# Altium schematic sheet Safety_Watchdog.SchDoc: 14 - Heartbeats, armamento e desligamento
size A3; Project: CM5 Photonic Bias Controller; DocumentRev: R5; ProjectRev: R5; Version: Rev R6; SheetNumber: 15; SheetTotal: 17; Author: Carlos Renan; SCH_SCALE: N/A; Address1: UFCG; Address2: Referencia: VIRTUS CC; Address3: Campina Grande - PB; ProjectName: Controle automatico de BIAS para MZM/IQ - Projeto 3; DocumentName: Safety_Watchdog.SchDoc
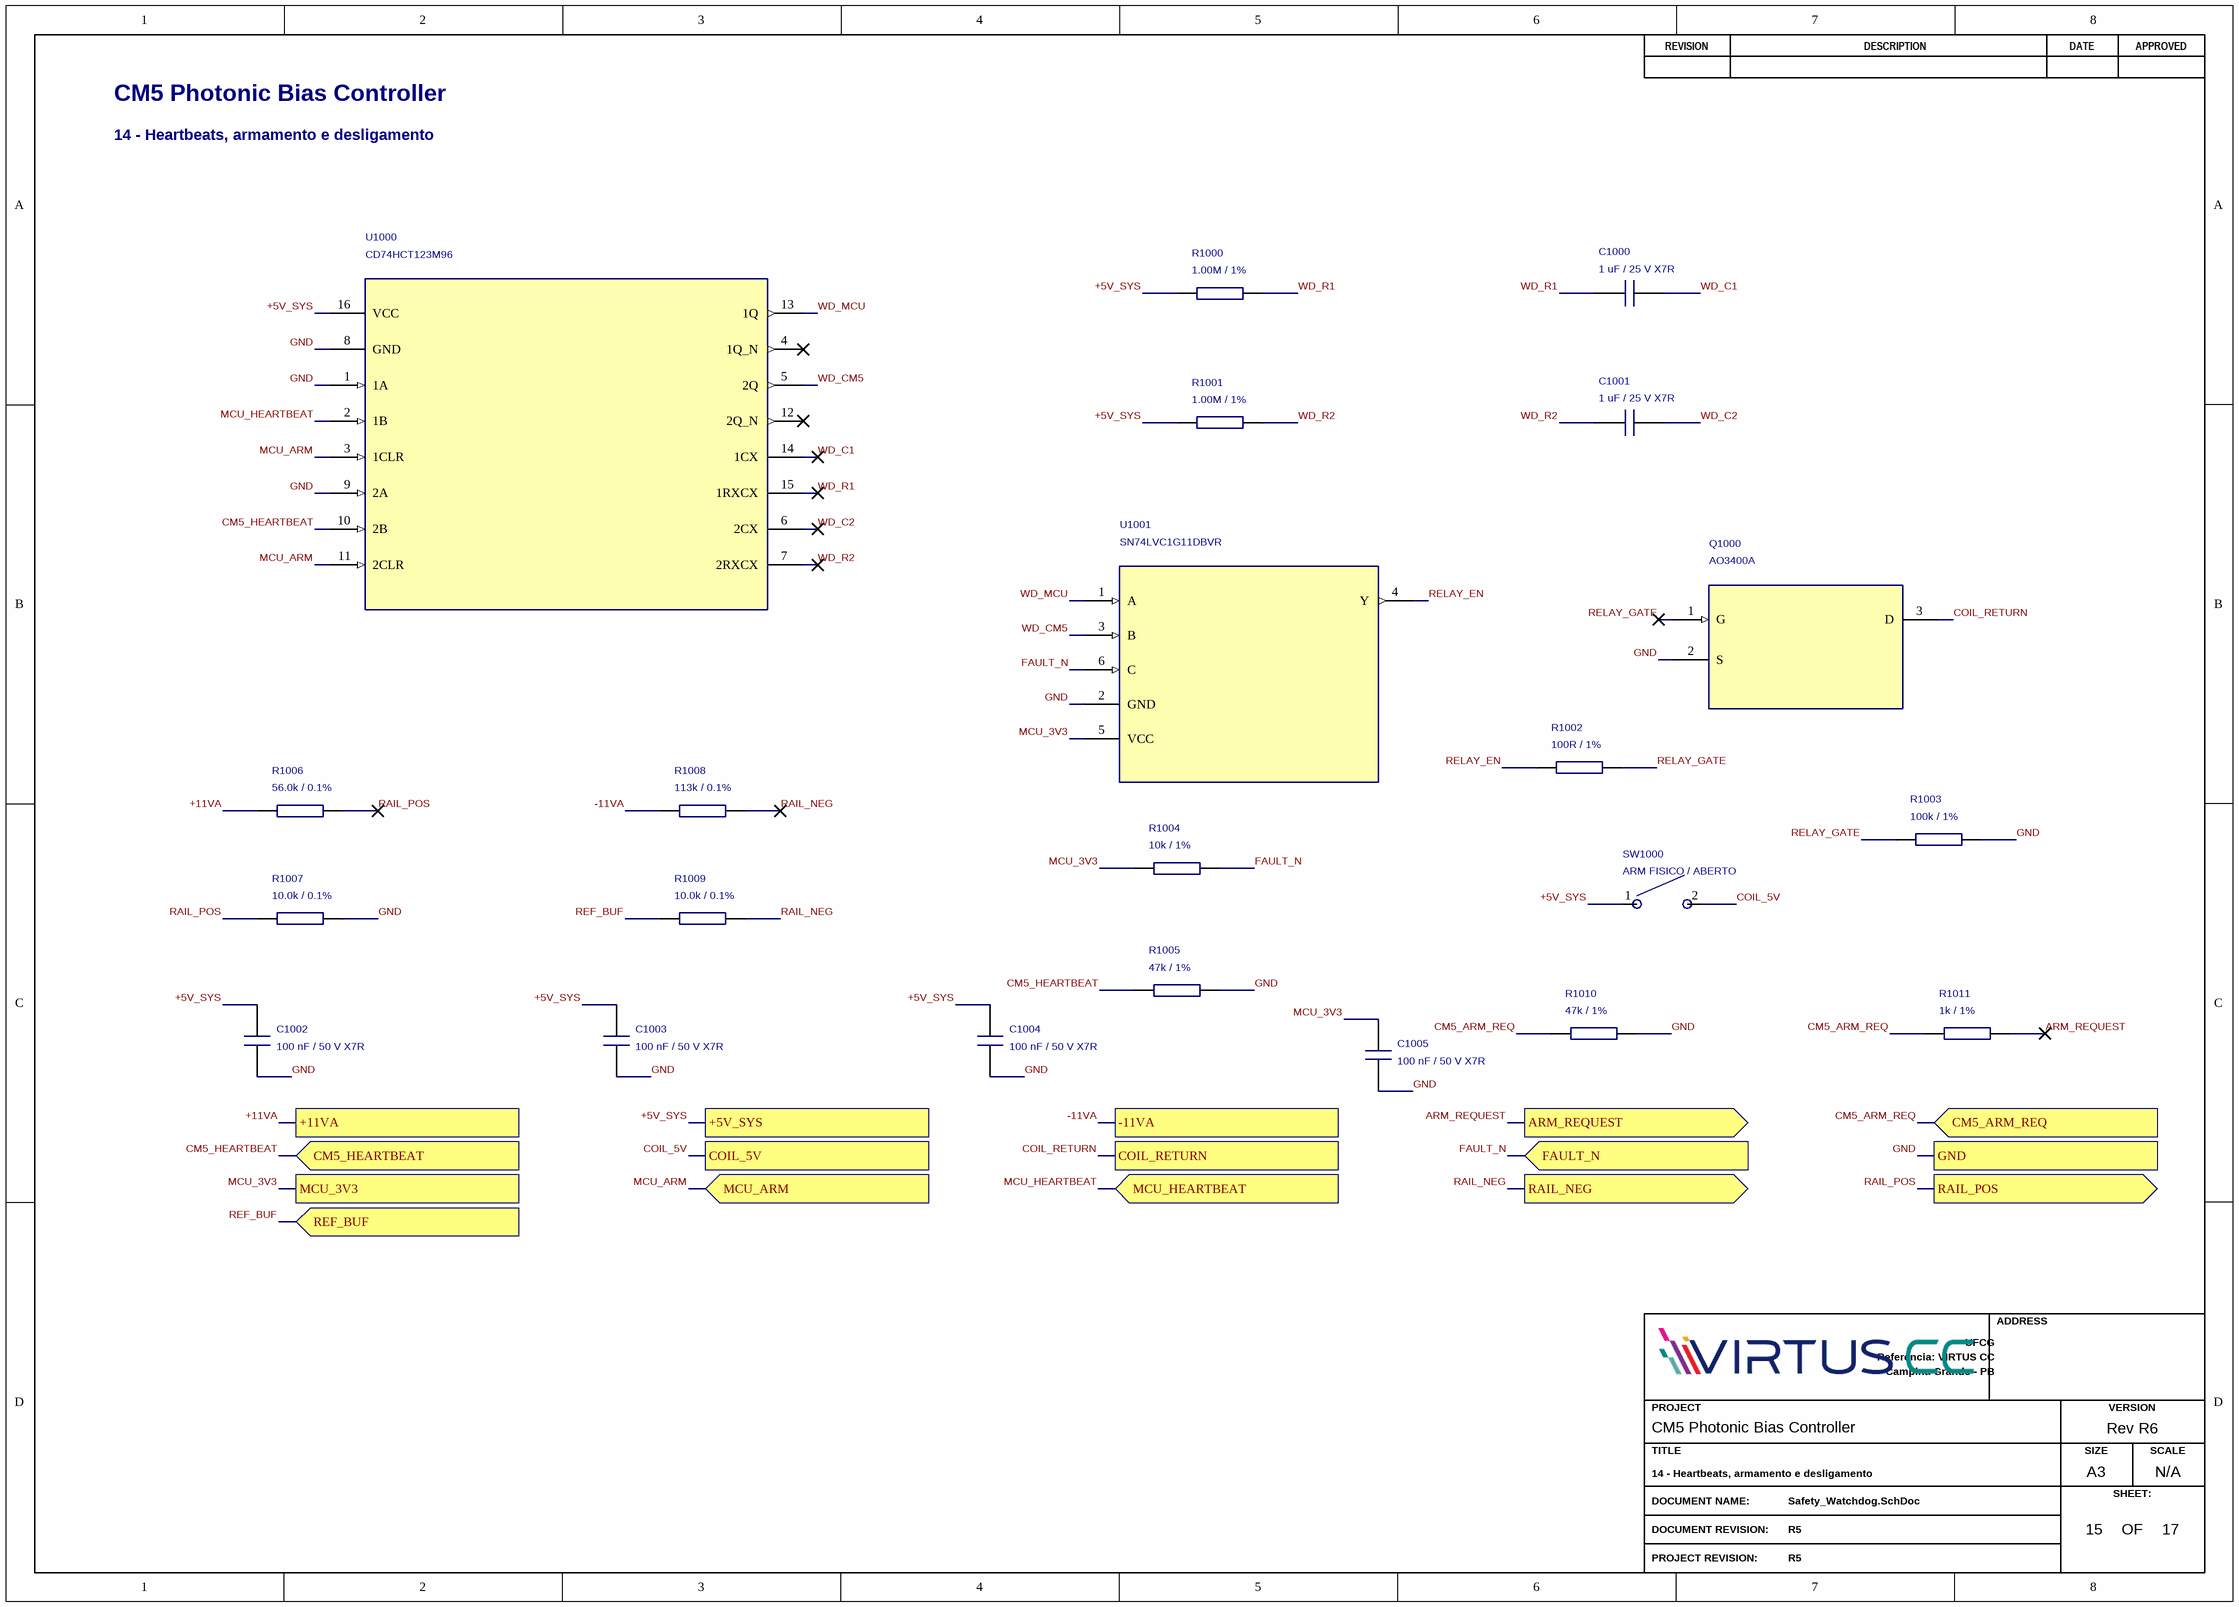
[diagram p0: Safety_Watchdog.SchDoc]

## Parts
C1000  1 uF / 25 V X7R  [C0805]
C1001  1 uF / 25 V X7R  [C0805]
C1002  100 nF / 50 V X7R  [C0805]
C1003  100 nF / 50 V X7R  [C0805]
C1004  100 nF / 50 V X7R  [C0805]
C1005  100 nF / 50 V X7R  [C0805]
Q1000  AO3400A  [ONSC-SOT-23-3-318-08_V]
R1000  1.00M / 1%  [R-0603]
R1001  1.00M / 1%  [R-0603]
R1002  100R / 1%  [R-0603]
R1003  100k / 1%  [R-0603]
R1004  10k / 1%  [R-0603]
R1005  47k / 1%  [R-0603]
R1006  56.0k / 0.1%  [R-0603]
R1007  10.0k / 0.1%  [R-0603]
R1008  113k / 0.1%  [R-0603]
R1009  10.0k / 0.1%  [R-0603]
R1010  47k / 1%  [R-0603]
R1011  1k / 1%  [R-0603]
SW1000  ARM FISICO / ABERTO  [HDR_1X02_P254]
U1000  CD74HCT123M96  [SOIC16]
U1001  SN74LVC1G11DBVR  [SOT26]

## Ports
+5V_SYS, +11VA, -11VA, ARM_REQUEST (out), CM5_ARM_REQ (in), CM5_HEARTBEAT (in), COIL_5V, COIL_RETURN, FAULT_N (in), GND, MCU_3V3, MCU_ARM (in), MCU_HEARTBEAT (in), RAIL_NEG (out), RAIL_POS (out), REF_BUF (in)

## Nets
+5V_SYS: C1002.1 C1003.1 C1004.1 R1000.1 R1001.1 SW1000.1 U1000.16(VCC) ; port +5V_SYS
+11VA: R1006.1 ; port +11VA
-11VA: R1008.1 ; port -11VA
ARM_REQUEST: R1011.2 ; port ARM_REQUEST
CM5_ARM_REQ: R1010.1 R1011.1 ; port CM5_ARM_REQ
CM5_HEARTBEAT: R1005.1 U1000.10(2B) ; port CM5_HEARTBEAT
COIL_5V: SW1000.2 ; port COIL_5V
COIL_RETURN: Q1000.3(D) ; port COIL_RETURN
FAULT_N: R1004.2 U1001.6(C) ; port FAULT_N
GND: C1002.2 C1003.2 C1004.2 C1005.2 Q1000.2(S) R1003.2 R1005.2 R1007.2 R1010.2 U1000.1(1A) U1000.8(GND) U1000.9(2A) U1001.2(GND) ; port GND
MCU_3V3: C1005.1 R1004.1 U1001.5(VCC) ; port MCU_3V3
MCU_ARM: U1000.3(1CLR) U1000.11(2CLR) ; port MCU_ARM
MCU_HEARTBEAT: U1000.2(1B) ; port MCU_HEARTBEAT
RAIL_NEG: R1008.2 R1009.2 ; port RAIL_NEG
RAIL_POS: R1006.2 R1007.1 ; port RAIL_POS
REF_BUF: R1009.1 ; port REF_BUF
RELAY_EN: R1002.1 U1001.4(Y)
RELAY_GATE: Q1000.1(G) R1002.2 R1003.1
WD_C1: C1000.2 U1000.14(1CX)
WD_C2: C1001.2 U1000.6(2CX)
WD_CM5: U1000.5(2Q) U1001.3(B)
WD_MCU: U1000.13(1Q) U1001.1(A)
WD_R1: C1000.1 R1000.2 U1000.15(1RXCX)
WD_R2: C1001.1 R1001.2 U1000.7(2RXCX)

Not connected (* = marked no-connect by the designer): U1000 4(1Q_N)* 12(2Q_N)*

## Notes on the sheet
- CM5 Photonic Bias Controller
- 14 - Heartbeats, armamento e desligamento
- REVISION
- DESCRIPTION
- DATE
- APPROVED
- ADDRESS
- PROJECT
- VERSION
- TITLE
- A3
- SIZE
- SCALE
- DOCUMENT NAME:
- DOCUMENT REVISION:
- OF
- SHEET:
- PROJECT REVISION:

## Library data of the parts
C1000 C1001 = 1 uF: Manufacturer: KEMET; Manufacturer Part Number: C0805C105K3RACTU; Procurement Status: Busca por MPN; SKU e disponibilidade a confirmar; BOM Purchase: Yes; Manufacturer 1: KEMET; Manufacturer Part Number 1: C0805C105K3RACTU; Supplier 1: DigiKey; Supplier URL 1: https://www.digikey.com.br/pt/products/result?keywords=C0805C105K3RACTU; Supplier 2: Mouser; Supplier URL 2: https://br.mouser.com/c/?q=C0805C105K3RACTU; Datasheet: https://www.yageogroup.com/download/specsheet/C0805C105K3RACTU
C1002-C1005 = 100 nF: Manufacturer: KEMET; Manufacturer Part Number: C0805C104K5RACTU; Procurement Status: Busca por MPN; SKU e disponibilidade a confirmar; BOM Purchase: Yes; Manufacturer 1: KEMET; Manufacturer Part Number 1: C0805C104K5RACTU; Supplier 1: DigiKey; Supplier URL 1: https://www.digikey.com.br/pt/products/result?keywords=C0805C104K5RACTU; Supplier 2: Mouser; Supplier URL 2: https://br.mouser.com/c/?q=C0805C104K5RACTU; Datasheet: https://www.yageogroup.com/download/specsheet/C0805C104K5RACTU
Q1000 = AO3400A: Manufacturer: Alpha & Omega Semiconductor; Procurement Status: Busca por MPN; SKU e disponibilidade a confirmar; BOM Purchase: Yes; Manufacturer Part Number: AO3400A; Manufacturer 1: Alpha & Omega Semiconductor; Manufacturer Part Number 1: AO3400A; Supplier 1: DigiKey; Supplier URL 1: https://www.digikey.com.br/pt/products/result?keywords=AO3400A; Supplier 2: Mouser; Supplier URL 2: https://br.mouser.com/c/?q=AO3400A; Datasheet: https://www.aosmd.com/sites/default/files/res/datasheets/AO3400A.pdf
R1000 R1001 = 1.00M: Manufacturer: YAGEO; Manufacturer Part Number: RC0603FR-071ML; Procurement Status: Busca por MPN; SKU e disponibilidade a confirmar; BOM Purchase: Yes; Manufacturer 1: YAGEO; Manufacturer Part Number 1: RC0603FR-071ML; Supplier 1: DigiKey; Supplier URL 1: https://www.digikey.com.br/pt/products/result?keywords=RC0603FR-071ML; Supplier 2: Mouser; Supplier URL 2: https://br.mouser.com/c/?q=RC0603FR-071ML; Datasheet: https://www.yageo.com/en/Product/Index/rchip
R1002 = 100R: Manufacturer: YAGEO; Manufacturer Part Number: RC0603FR-07100RL; Procurement Status: Busca por MPN; SKU e disponibilidade a confirmar; BOM Purchase: Yes; Manufacturer 1: YAGEO; Manufacturer Part Number 1: RC0603FR-07100RL; Supplier 1: DigiKey; Supplier URL 1: https://www.digikey.com.br/pt/products/result?keywords=RC0603FR-07100RL; Supplier 2: Mouser; Supplier URL 2: https://br.mouser.com/c/?q=RC0603FR-07100RL; Datasheet: https://www.yageo.com/en/Product/Index/rchip
R1003 = 100k: Manufacturer: YAGEO; Manufacturer Part Number: RC0603FR-07100KL; Procurement Status: Busca por MPN; SKU e disponibilidade a confirmar; BOM Purchase: Yes; Manufacturer 1: YAGEO; Manufacturer Part Number 1: RC0603FR-07100KL; Supplier 1: DigiKey; Supplier URL 1: https://www.digikey.com.br/pt/products/result?keywords=RC0603FR-07100KL; Supplier 2: Mouser; Supplier URL 2: https://br.mouser.com/c/?q=RC0603FR-07100KL; Datasheet: https://www.yageo.com/en/Product/Index/rchip
R1004 = 10k: Manufacturer: YAGEO; Manufacturer Part Number: RC0603FR-0710KL; Procurement Status: Busca por MPN; SKU e disponibilidade a confirmar; BOM Purchase: Yes; Manufacturer 1: YAGEO; Manufacturer Part Number 1: RC0603FR-0710KL; Supplier 1: DigiKey; Supplier URL 1: https://www.digikey.com.br/pt/products/result?keywords=RC0603FR-0710KL; Supplier 2: Mouser; Supplier URL 2: https://br.mouser.com/c/?q=RC0603FR-0710KL; Datasheet: https://www.yageo.com/en/Product/Index/rchip
R1005 R1010 = 47k: Manufacturer: YAGEO; Manufacturer Part Number: RC0603FR-0747KL; Procurement Status: Busca por MPN; SKU e disponibilidade a confirmar; BOM Purchase: Yes; Manufacturer 1: YAGEO; Manufacturer Part Number 1: RC0603FR-0747KL; Supplier 1: DigiKey; Supplier URL 1: https://www.digikey.com.br/pt/products/result?keywords=RC0603FR-0747KL; Supplier 2: Mouser; Supplier URL 2: https://br.mouser.com/c/?q=RC0603FR-0747KL; Datasheet: https://www.yageo.com/en/Product/Index/rchip
R1006 = 56.0k: Manufacturer: YAGEO; Manufacturer Part Number: RT0603BRD0756KL; Review: Filme fino, 0,1%, 25 ppm/K; 0,1 W. Verificar dissipacao em R210/R212 e matching dos drivers.; Procurement Status: Busca por MPN; SKU e disponibilidade a confirmar; BOM Purchase: Yes; Manufacturer 1: YAGEO; Manufacturer Part Number 1: RT0603BRD0756KL; Supplier 1: DigiKey; Supplier URL 1: https://www.digikey.com.br/pt/products/result?keywords=RT0603BRD0756KL; Supplier 2: Mouser; Supplier URL 2: https://br.mouser.com/c/?q=RT0603BRD0756KL; Datasheet: https://www.yageo.com/en/Product/Index/rchip
R1007 R1009 = 10.0k: Manufacturer: YAGEO; Manufacturer Part Number: RT0603BRD0710KL; Review: Filme fino, 0,1%, 25 ppm/K; 0,1 W. Verificar dissipacao em R210/R212 e matching dos drivers.; Procurement Status: Busca por MPN; SKU e disponibilidade a confirmar; BOM Purchase: Yes; Manufacturer 1: YAGEO; Manufacturer Part Number 1: RT0603BRD0710KL; Supplier 1: DigiKey; Supplier URL 1: https://www.digikey.com.br/pt/products/result?keywords=RT0603BRD0710KL; Supplier 2: Mouser; Supplier URL 2: https://br.mouser.com/c/?q=RT0603BRD0710KL; Datasheet: https://www.yageo.com/en/Product/Index/rchip
R1008 = 113k: Manufacturer: YAGEO; Manufacturer Part Number: RT0603BRD07113KL; Review: Filme fino, 0,1%, 25 ppm/K; 0,1 W. Verificar dissipacao em R210/R212 e matching dos drivers.; Procurement Status: Busca por MPN; SKU e disponibilidade a confirmar; BOM Purchase: Yes; Manufacturer 1: YAGEO; Manufacturer Part Number 1: RT0603BRD07113KL; Supplier 1: DigiKey; Supplier URL 1: https://www.digikey.com.br/pt/products/result?keywords=RT0603BRD07113KL; Supplier 2: Mouser; Supplier URL 2: https://br.mouser.com/c/?q=RT0603BRD07113KL; Datasheet: https://www.yageo.com/en/Product/Index/rchip
R1011 = 1k: Manufacturer: YAGEO; Manufacturer Part Number: RC0603FR-071KL; Procurement Status: Busca por MPN; SKU e disponibilidade a confirmar; BOM Purchase: Yes; Manufacturer 1: YAGEO; Manufacturer Part Number 1: RC0603FR-071KL; Supplier 1: DigiKey; Supplier URL 1: https://www.digikey.com.br/pt/products/result?keywords=RC0603FR-071KL; Supplier 2: Mouser; Supplier URL 2: https://br.mouser.com/c/?q=RC0603FR-071KL; Datasheet: https://www.yageo.com/en/Product/Index/rchip
SW1000 = ARM FISICO: Manufacturer: Wurth Elektronik; Manufacturer Part Number: 61300211121; Review: Header 1x2; shunt removivel listado como acessorio. SW1000 inicia aberto.; Procurement Status: Busca por MPN; SKU e disponibilidade a confirmar; BOM Purchase: Yes; Manufacturer 1: Wurth Elektronik; Manufacturer Part Number 1: 61300211121; Supplier 1: DigiKey; Supplier URL 1: https://www.digikey.com.br/pt/products/result?keywords=61300211121; Supplier 2: Mouser; Supplier URL 2: https://br.mouser.com/c/?q=61300211121; Datasheet: https://www.we-online.com/components/products/datasheet/61300211121.pdf
U1000 = CD74HCT123M96: Manufacturer: Texas Instruments; Procurement Status: Busca por MPN; SKU e disponibilidade a confirmar; BOM Purchase: Yes; Manufacturer Part Number: CD74HCT123M96; Manufacturer 1: Texas Instruments; Manufacturer Part Number 1: CD74HCT123M96; Supplier 1: DigiKey; Supplier URL 1: https://www.digikey.com.br/pt/products/result?keywords=CD74HCT123M96; Supplier 2: Mouser; Supplier URL 2: https://br.mouser.com/c/?q=CD74HCT123M96; Datasheet: https://www.ti.com/lit/ds/symlink/cd74hct123.pdf
U1001 = SN74LVC1G11DBVR: Manufacturer: Texas Instruments; Procurement Status: Busca por MPN; SKU e disponibilidade a confirmar; BOM Purchase: Yes; Manufacturer Part Number: SN74LVC1G11DBVR; Manufacturer 1: Texas Instruments; Manufacturer Part Number 1: SN74LVC1G11DBVR; Supplier 1: DigiKey; Supplier URL 1: https://www.digikey.com.br/pt/products/result?keywords=SN74LVC1G11DBVR; Supplier 2: Mouser; Supplier URL 2: https://br.mouser.com/c/?q=SN74LVC1G11DBVR; Datasheet: https://www.ti.com/lit/ds/symlink/sn74lvc1g11.pdf